# Altium schematic sheet DIOT_SMA_BASE_Split.schdoc: =DocumentName
size A3; EDA_Number: DIOT; Projet: KASLI 3U subsystem; ModifiedBy: -; CreateDate: XX/XX/XXXX; CheckedDate: -; DivGrp: ISE; Designer: A.B.; DocumentNumber: 1; Revision: 0; SheetNumber: 15; SheetTotal: 17
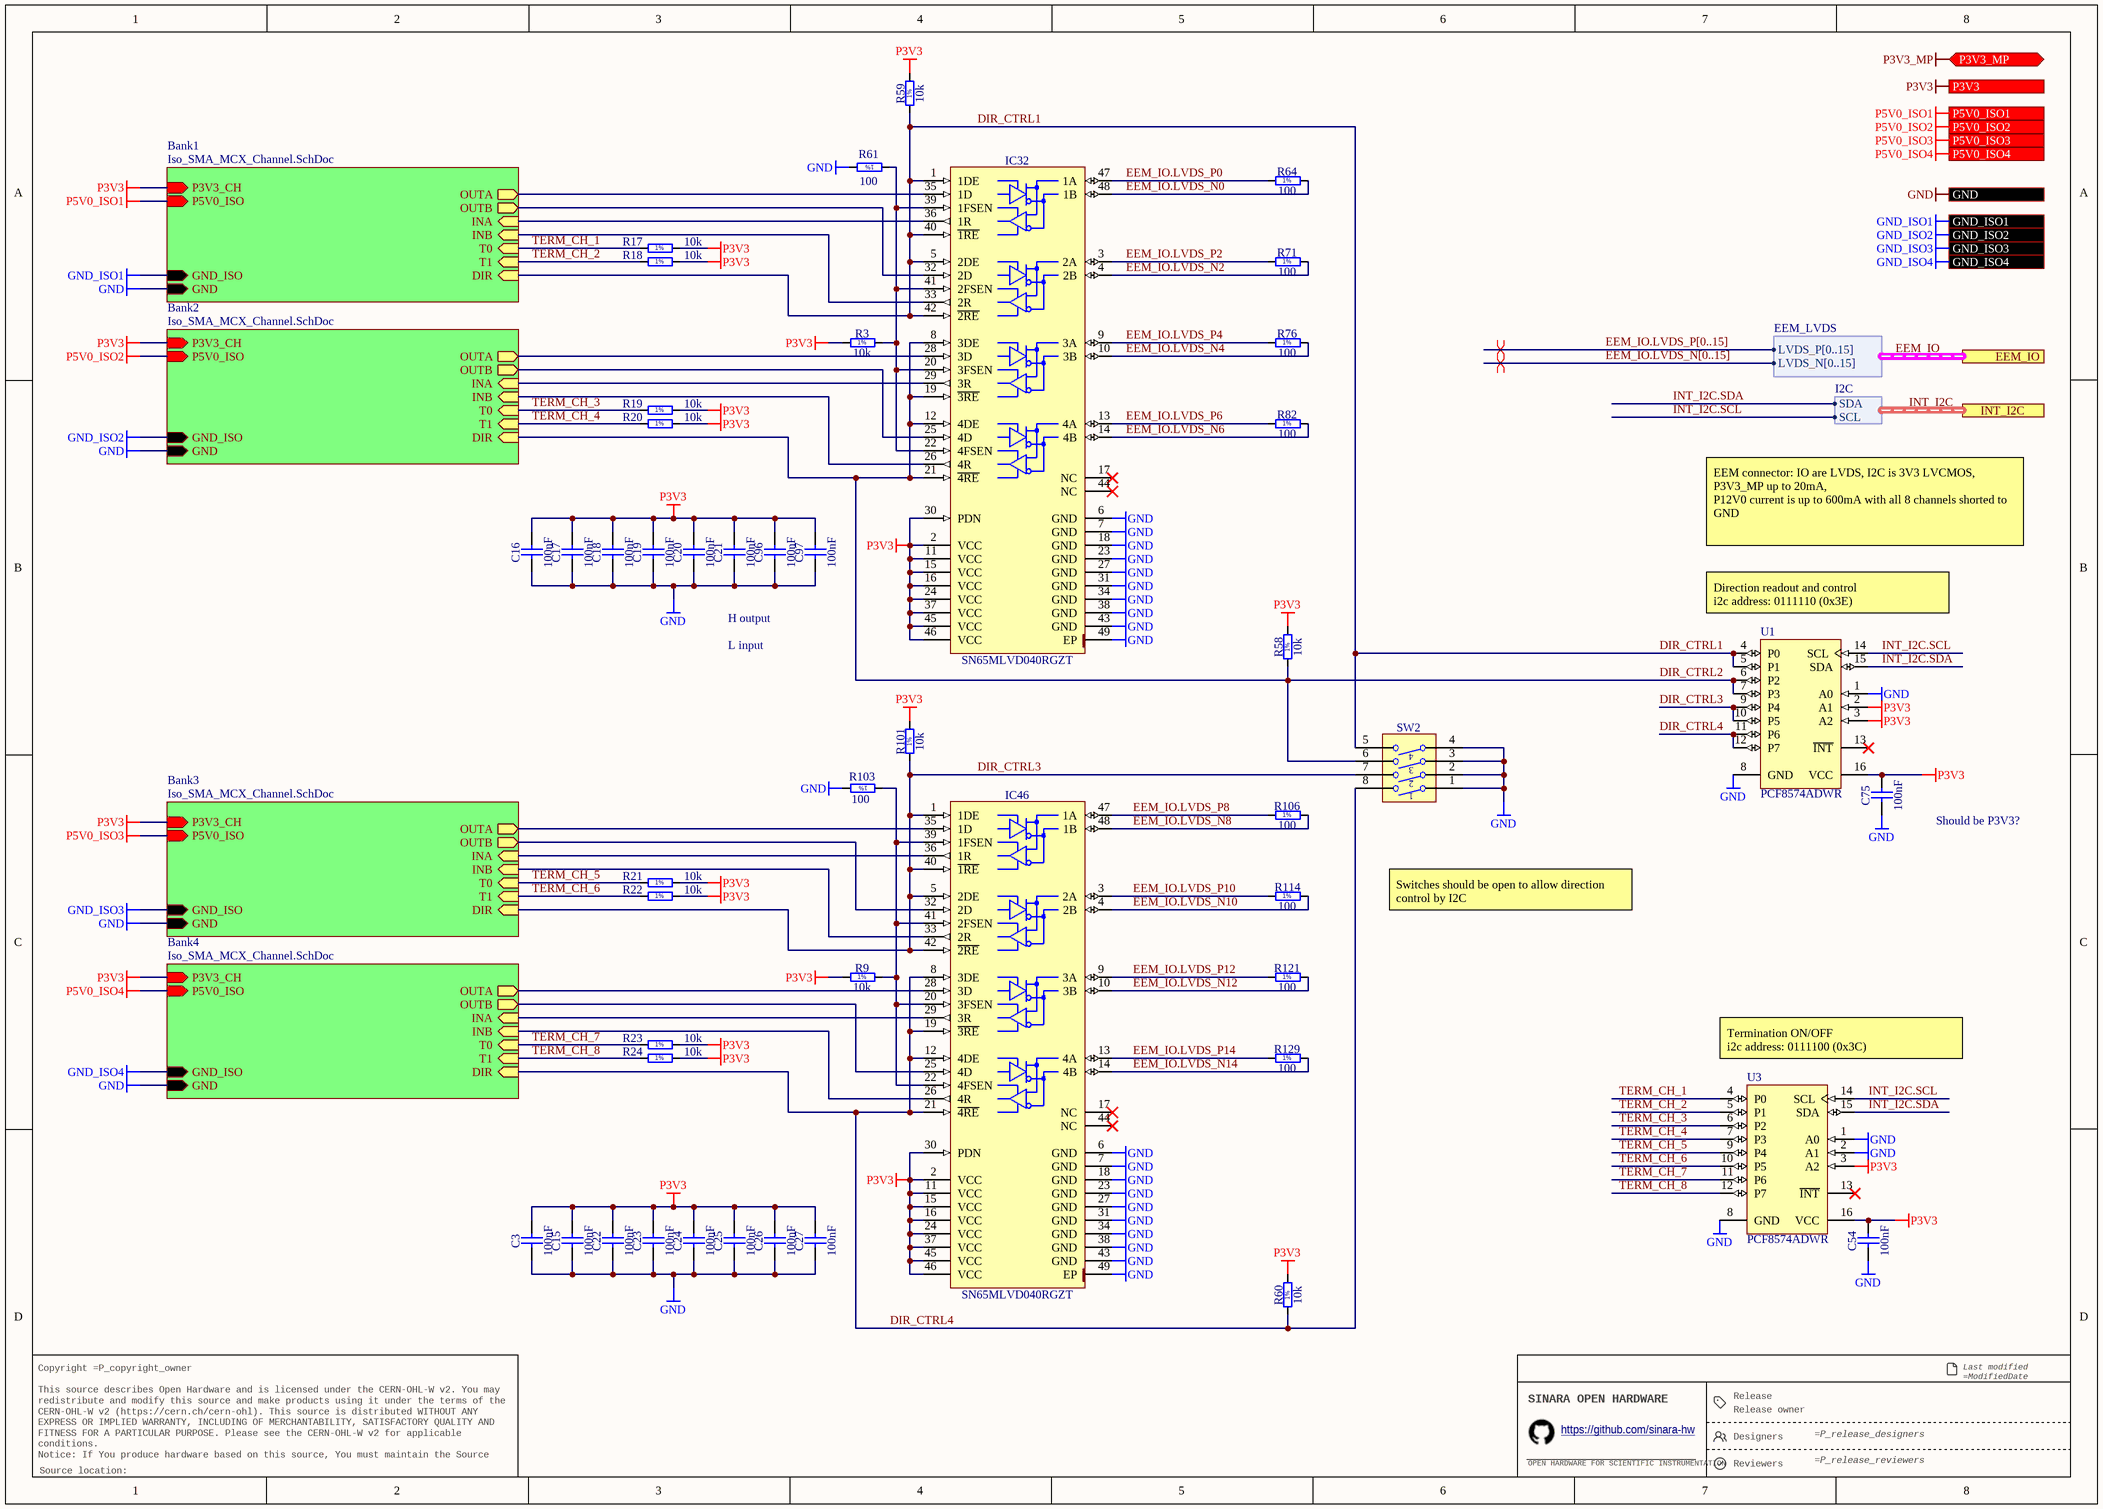
[diagram p0: DIOT_SMA_BASE_Split.schdoc]

## Parts
C3  100nF  [CAPC1005X55N]
C15  100nF  [CAPC1005X55N]
C16  100nF  [CAPC1005X55N]
C17  100nF  [CAPC1005X55N]
C18  100nF  [CAPC1005X55N]
C19  100nF  [CAPC1005X55N]
C20  100nF  [CAPC1005X55N]
C21  100nF  [CAPC1005X55N]
C22  100nF  [CAPC1005X55N]
C23  100nF  [CAPC1005X55N]
C24  100nF  [CAPC1005X55N]
C25  100nF  [CAPC1005X55N]
C26  100nF  [CAPC1005X55N]
C27  100nF  [CAPC1005X55N]
C54  100nF  [CAPC1005X55N]
C75  100nF  [CAPC1005X55N]
C96  100nF  [CAPC1005X55N]
C97  100nF  [CAPC1005X55N]
IC32  SN65MLVD040RGZT  [QFN50P700X700X100-49N-S420]
IC46  SN65MLVD040RGZT  [QFN50P700X700X100-49N-S420]
R3  10k  [RESC1005X40N]
R9  10k  [RESC1005X40N]
R17  10k  [RESC1005X40N]
R18  10k  [RESC1005X40N]
R19  10k  [RESC1005X40N]
R20  10k  [RESC1005X40N]
R21  10k  [RESC1005X40N]
R22  10k  [RESC1005X40N]
R23  10k  [RESC1005X40N]
R24  10k  [RESC1005X40N]
R58  10k  [RESC1005X40N]
R59  10k  [RESC1005X40N]
R60  10k  [RESC1005X40N]
R61  100  [RESC1005X40N]
R64  100  [RESC1005X40N]
R71  100  [RESC1005X40N]
R76  100  [RESC1005X40N]
R82  100  [RESC1005X40N]
R101  10k  [RESC1005X40N]
R103  100  [RESC1005X40N]
R106  100  [RESC1005X40N]
R114  100  [RESC1005X40N]
R121  100  [RESC1005X40N]
R129  100  [RESC1005X40N]
SW2  Switch  [SW_OMRON_A6S-4102-H]  (value not drawn)
U1  PCF8574ADWR  [DW0016A_M]
U3  PCF8574ADWR  [DW0016A_M]

## Sub-sheets
Bank1 = Iso_SMA_MCX_Channel.SchDoc: OUTA (out), OUTB (out), INA (in), INB (in), DIR (in), P3V3_CH (in), P5V0_ISO (in), GND_ISO (in), GND (in), T1 (in), T0 (in)
Bank2 = Iso_SMA_MCX_Channel.SchDoc: OUTA (out), OUTB (out), INA (in), INB (in), DIR (in), P3V3_CH (in), P5V0_ISO (in), GND_ISO (in), GND (in), T1 (in), T0 (in)
Bank3 = Iso_SMA_MCX_Channel.SchDoc: OUTA (out), OUTB (out), INA (in), INB (in), DIR (in), P3V3_CH (in), P5V0_ISO (in), GND_ISO (in), GND (in), T0 (in), T1 (in)
Bank4 = Iso_SMA_MCX_Channel.SchDoc: OUTA (out), OUTB (out), INA (in), INB (in), DIR (in), P3V3_CH (in), P5V0_ISO (in), GND_ISO (in), GND (in), T1 (in), T0 (in)

## Ports
EEM_IO (harness EEM_LVDS), GND, GND_ISO1, GND_ISO2, GND_ISO3, GND_ISO4, INT_I2C (harness I2C), P3V3 (out), P3V3_MP (bidir), P5V0_ISO1 (out), P5V0_ISO2 (out), P5V0_ISO3 (out), P5V0_ISO4 (out)

## Harnesses
I2C: SDA, SCL
EEM_LVDS: LVDS_P[0..15], LVDS_N[0..15]

## Nets
GND: C3.1 C15.1 C16.1 C17.1 C18.1 C19.1 C20.1 C21.1 C22.1 C23.1 C24.1 C25.1 C26.1 C27.1 C54.1 C75.1 C96.1 C97.1 IC32.6(GND) IC32.7(GND) IC32.18(GND) IC32.23(GND) IC32.27(GND) IC32.31(GND) IC32.34(GND) IC32.38(GND) IC32.43(GND) IC32.49(EP) IC46.6(GND) IC46.7(GND) IC46.18(GND) IC46.23(GND) IC46.27(GND) IC46.31(GND) IC46.34(GND) IC46.38(GND) IC46.43(GND) IC46.49(EP) R61.2 R103.2 SW2.1 SW2.2 SW2.3 SW2.4 U1.1(A0) U1.8(GND) U3.1(A0) U3.2(A1) U3.8(GND) ; port GND, sheet Bank1/GND, sheet Bank2/GND, sheet Bank3/GND, sheet Bank4/GND
GND_ISO1: port GND_ISO1, sheet Bank1/GND_ISO
GND_ISO2: port GND_ISO2, sheet Bank2/GND_ISO
GND_ISO3: port GND_ISO3, sheet Bank3/GND_ISO
GND_ISO4: port GND_ISO4, sheet Bank4/GND_ISO
P3V3: C3.2 C15.2 C16.2 C17.2 C18.2 C19.2 C20.2 C21.2 C22.2 C23.2 C24.2 C25.2 C26.2 C27.2 C54.2 C75.2 C96.2 C97.2 IC32.2(VCC) IC32.11(VCC) IC32.15(VCC) IC32.16(VCC) IC32.24(VCC) IC32.30(PDN) IC32.37(VCC) IC32.45(VCC) IC32.46(VCC) IC46.2(VCC) IC46.11(VCC) IC46.15(VCC) IC46.16(VCC) IC46.24(VCC) IC46.30(PDN) IC46.37(VCC) IC46.45(VCC) IC46.46(VCC) R3.1 R9.1 R17.2 R18.2 R19.2 R20.2 R21.2 R22.2 R23.2 R24.2 R58.2 R59.2 R60.2 R101.2 U1.2(A1) U1.3(A2) U1.16(VCC) U3.3(A2) U3.16(VCC) ; port P3V3, sheet Bank1/P3V3_CH, sheet Bank2/P3V3_CH, sheet Bank3/P3V3_CH, sheet Bank4/P3V3_CH
P3V3_MP: port P3V3_MP
P5V0_ISO1: port P5V0_ISO1, sheet Bank1/P5V0_ISO
P5V0_ISO2: port P5V0_ISO2, sheet Bank2/P5V0_ISO
P5V0_ISO3: port P5V0_ISO3, sheet Bank3/P5V0_ISO
P5V0_ISO4: port P5V0_ISO4, sheet Bank4/P5V0_ISO
DIR_CTRL1: IC32.1(1DE) IC32.5(2DE) IC32.40(~{1RE}) IC32.42(~{2RE}) R59.1 SW2.5 U1.4(P0) U1.5(P1) ; sheet Bank1/DIR
DIR_CTRL2: IC32.8(3DE) IC32.12(4DE) IC32.19(~{3RE}) IC32.21(~{4RE}) R58.1 SW2.6 U1.6(P2) U1.7(P3) ; sheet Bank2/DIR
DIR_CTRL3: IC46.1(1DE) IC46.5(2DE) IC46.40(~{1RE}) IC46.42(~{2RE}) R101.1 SW2.7 U1.9(P4) U1.10(P5) ; sheet Bank3/DIR
DIR_CTRL4: IC46.8(3DE) IC46.12(4DE) IC46.19(~{3RE}) IC46.21(~{4RE}) R60.1 SW2.8 U1.11(P6) U1.12(P7) ; sheet Bank4/DIR
EEM_IO.LVDS_N0: IC32.48(1B) R64.2
EEM_IO.LVDS_N2: IC32.4(2B) R71.2
EEM_IO.LVDS_N4: IC32.10(3B) R76.2
EEM_IO.LVDS_N6: IC32.14(4B) R82.2
EEM_IO.LVDS_N8: IC46.48(1B) R106.2
EEM_IO.LVDS_N10: IC46.4(2B) R114.2
EEM_IO.LVDS_N12: IC46.10(3B) R121.2
EEM_IO.LVDS_N14: IC46.14(4B) R129.2
EEM_IO.LVDS_P0: IC32.47(1A) R64.1
EEM_IO.LVDS_P2: IC32.3(2A) R71.1
EEM_IO.LVDS_P4: IC32.9(3A) R76.1
EEM_IO.LVDS_P6: IC32.13(4A) R82.1
EEM_IO.LVDS_P8: IC46.47(1A) R106.1
EEM_IO.LVDS_P10: IC46.3(2A) R114.1
EEM_IO.LVDS_P12: IC46.9(3A) R121.1
EEM_IO.LVDS_P14: IC46.13(4A) R129.1
INT_I2C.SCL: U1.14(SCL) U3.14(SCL) ; port INT_I2C.SCL
INT_I2C.SDA: U1.15(SDA) U3.15(SDA) ; port INT_I2C.SDA
TERM_CH_1: R17.1 U3.4(P0) ; sheet Bank1/T0
TERM_CH_2: R18.1 U3.5(P1) ; sheet Bank1/T1
TERM_CH_3: R19.1 U3.6(P2) ; sheet Bank2/T0
TERM_CH_4: R20.1 U3.7(P3) ; sheet Bank2/T1
TERM_CH_5: R21.1 U3.9(P4) ; sheet Bank3/T0
TERM_CH_6: R22.1 U3.10(P5) ; sheet Bank3/T1
TERM_CH_7: R23.1 U3.11(P6) ; sheet Bank4/T0
TERM_CH_8: R24.1 U3.12(P7) ; sheet Bank4/T1
NetIC32_20: IC32.20(3FSEN) IC32.22(4FSEN) IC32.39(1FSEN) IC32.41(2FSEN) R3.2 R61.1
NetIC32_25: IC32.25(4D) ; sheet Bank2/OUTB
NetIC32_26: IC32.26(4R) ; sheet Bank2/INB
NetIC32_28: IC32.28(3D) ; sheet Bank2/OUTA
NetIC32_29: IC32.29(3R) ; sheet Bank2/INA
NetIC32_32: IC32.32(2D) ; sheet Bank1/OUTB
NetIC32_33: IC32.33(2R) ; sheet Bank1/INB
NetIC32_35: IC32.35(1D) ; sheet Bank1/OUTA
NetIC32_36: IC32.36(1R) ; sheet Bank1/INA
NetIC46_20: IC46.20(3FSEN) IC46.22(4FSEN) IC46.39(1FSEN) IC46.41(2FSEN) R9.2 R103.1
NetIC46_25: IC46.25(4D) ; sheet Bank4/OUTB
NetIC46_26: IC46.26(4R) ; sheet Bank4/INB
NetIC46_28: IC46.28(3D) ; sheet Bank4/OUTA
NetIC46_29: IC46.29(3R) ; sheet Bank4/INA
NetIC46_32: IC46.32(2D) ; sheet Bank3/OUTB
NetIC46_33: IC46.33(2R) ; sheet Bank3/INB
NetIC46_35: IC46.35(1D) ; sheet Bank3/OUTA
NetIC46_36: IC46.36(1R) ; sheet Bank3/INA

Not connected (* = marked no-connect by the designer): IC32 17(NC)* 44(NC)*; IC46 17(NC)* 44(NC)*; U1 13(~{INT})*; U3 13(~{INT})*

## Buses and harness runs
bus EEM_IO.LVDS_N[0..15]
bus EEM_IO.LVDS_P[0..15]
harness EEM_IO = port EEM_IO
harness INT_I2C = port INT_I2C

## Layout directives
differential pair; differential pair class Diff_100Ohm: (no net found under the mark)

## Notes on the sheet
- EEM connector: IO are LVDS, I2C is 3V3 LVCMOS, P3V3_MP up to 20mA,
  P12V0 current is up to 600mA with all 8 channels shorted to GND
- H output
- L input
- (near U1) Direction readout and control
  i2c address: 0111110 (0x3E)
- Should be P3V3?
- Switches should be open to allow direction control by I2C
- (near U3) Termination ON/OFF
  i2c address: 0111100 (0x3C)
- Release
- Last modified =ModifiedDate
  Sheet =sheetnumber of =sheettotal · Size A3
- Copyright =P_copyright_owner
  This source describes Open Hardware and is licensed under the CERN-OHL-W v2. You may redistribute and modify this source and make products using it under the terms of the CERN-OHL-W v2 (https://cern.ch/cern-ohl). This source is distributed WITHOUT ANY EXPRESS OR IMPLIED WARRANTY, INCLUDING OF MERCHANTABILITY, SATISFACTORY QUALITY AND FITNESS FOR A PARTICULAR PURPOSE. Please see the CERN-OHL-W v2 for applicable conditions.
  Notice: If You produce hardware based on this source, You must maintain the Source Location visible on the product, its packaging or its documentation.
- SINARA OPEN HARDWARE
- OPEN HARDWARE FOR SCIENTIFIC INSTRUMENTATION
- https://github.com/sinara-hw
- Release owner
- Designers
- Reviewers
- Source location:
- (in symbol R0402_10K_1%_0.0625W_100PPM) 1%
- (in symbol R0402_100R_1%_0.1W_100PPM) 1%

## Library data of the parts
C3 C15-C27 C54 C75 C96 C97 = CC0402_100NF_50V_10%_X7R: Non-polarised capacitor; Part Description: SMD Multilayer Chip Ceramic Capacitor; Manufacturer: GENERIC; Manufacturer1 Part Number: GRM155R71H104KE14D; Voltage: 50V; TC: X7R; Tolerance: ±10%; Part Number: CC0402_100NF_50V_10%_X7R; Component Kind: Standard; Component Type: Standard; Pin Count: 2; Value: 100nF; Status: None; Manufacturer Part Number: CC0402_100NF_50V_10%_X7R; Case: 0402; Mounted: Yes; Socket: No; SMD: Yes; Sense: No; HelpURL: \\cern.ch\dfs\Applications\Altium\Datasheets\CC0402_MURATA_GRM155R71H104KE14D.pdf; Author: CERN DEM MR; CreateDate: 30.06.2017; LatestRevisionDate: 30.06.2017; Manufacturer1 Example: MURATA; Manufacturer1 ComponentHeight: 0.55mm
IC32 IC46 = SN65MLVD040RGZT: 4-Channel Half-Duplex M-LVDS Line Transceiver; Manufacturer: TEXAS INSTRUMENTS; PressFit: No; Bonding: No; Part Number: SN65MLVD040RGZT; Component Kind: Standard; Component Type: Standard; Device: SN65MLVD040RGZT; PackageDescription: QFN, 0.50mm Pitch, Square; 48 Pin, 7.00mm L X 7.00mm W X 1mm H body (W/Thermal Tab 4.2mm X 4.2mm), IPC Medium Density; Part Description: 4-Channel Half-Duplex M-LVDS Line Transceiver; Manufacturer Part Number: SN65MLVD040RGZT; Pin Count: 49; Case: QFN48; Mounted: Yes; Socket: No; SMD: Yes; Sense: No; ComponentHeight: 1mm; Author: CERN DEM JLC; HelpURL: \\cern.ch\dfs\Applications\Altium\Datasheets\SN65MLVD040RGZT.pdf; CreateDate: 17.03.2011; LatestRevisionDate: 17.03.2011
R3 R9 R17-R24 R58-R60 R101 = R0402_10K_1%_0.0625W_100PPM: Resistor - 1%; Part Description: General Purpose Thick Film Chip Resistor; Manufacturer: GENERIC; Manufacturer1 Part Number: 232270671003L; TC: ±100ppm/°C; Part Number: R0402_10K_1%_0.0625W_100PPM; Component Kind: Standard; Component Type: Standard; Pin Count: 2; Value: 10k; Status: Not recommended; Power: 0.0625W; Tolerance: ±1%; Manufacturer Part Number: R0402_10K_1%_0.0625W_100PPM; Case: 0402; Mounted: Yes; Sense: No; Socket: No; SMD: Yes; Manufacturer1 Example: YAGEO PHYCOMP; Manufacturer1 ComponentHeight: 0.4mm; HelpURL: \\cern.ch\dfs\Applications\Altium\Datasheets\R0402_Phycomp_RC0402.pdf; Author: CERN DEM JLC; CreateDate: 03.12.2007; LatestRevisionDate: 17.10.2012
R61 R64 R71 R76 R82 R103 R106 R114 R121 R129 = R0402_100R_1%_0.1W_100PPM: Resistor - 1%; Part Description: General Purpose Thick Film Chip Resistor; Manufacturer: GENERIC; Manufacturer Part Number: R0402_100R_1%_0.1W_100PPM_50V; Manufacturer1 Part Number: ERJ2RKF1000X; Power: 0.1W; TC: ±100ppm/°C; Voltage: 50V; Part Number: R0402_100R_1%_0.1W_100PPM; Component Kind: Standard; Component Type: Standard; Pin Count: 2; Value: 100; Status: Not recommended; Tolerance: ±1%; Case: 0402; Mounted: Yes; Sense: No; Socket: No; SMD: Yes; Manufacturer1 Example: PANASONIC; Manufacturer1 ComponentHeight: 0.4mm; HelpURL: \\cern.ch\dfs\Applications\Altium\Datasheets\R0402_PANASONIC_ERJ2RK.pdf; Author: CERN DEM JLC; CreateDate: 12.12.2013; LatestRevisionDate: 03.03.2015
SW2 = SW_OMRON_A6S-4102-H: 4 Ways SPST DIP Switch; Part Description: 4 Ways SPST DIP Switch, White Flat Actuator with Seal Tape, Contact Rating 25mA 24VDC; Manufacturer: OMRON; PressFit: No; Part Number: SW_OMRON_A6S-4102-H; Component Kind: Standard; Component Type: Standard; Pin Count: 8; PackageDescription: Pitch 2.54mm, Body 11.3x6.4mm, 4 Ways SPST Surface-Mounting DIP Switch, OMRON A6S-H; Family: Switch; Mounted: Yes; Socket: No; SMD: Yes; Sense: No; Status: None; Manufacturer Part Number: A6S-4102-H; ComponentHeight: 3.8mm; HelpURL: \\cern.ch\dfs\Applications\Altium\Datasheets\SW_OMRON_A6S-4102-H.pdf; Author: CERN DEM JMW; CreateDate: 25.09.2008; LatestRevisionDate: 25.09.2008
U1 U3 = CMP-015-00013-1: 8-bit 2.5- to 5.5-V I2C/SMBus I/O expander with interrupt 16-SOIC -40 to 85; Manufacturer: Texas Instruments; Max Supply Voltage: 6V; Min Supply Voltage: 2.5V; Case/Package: SOIC; Manufacturer Part Number: PCF8574ADWR; Pins: 16; Min Operating Temperature: -40°C; Max Operating Temperature: 85°C